# EasyEDA Pro project ProPrj_omb-2024-nano_2026-02-09.epro, board PCB1_1
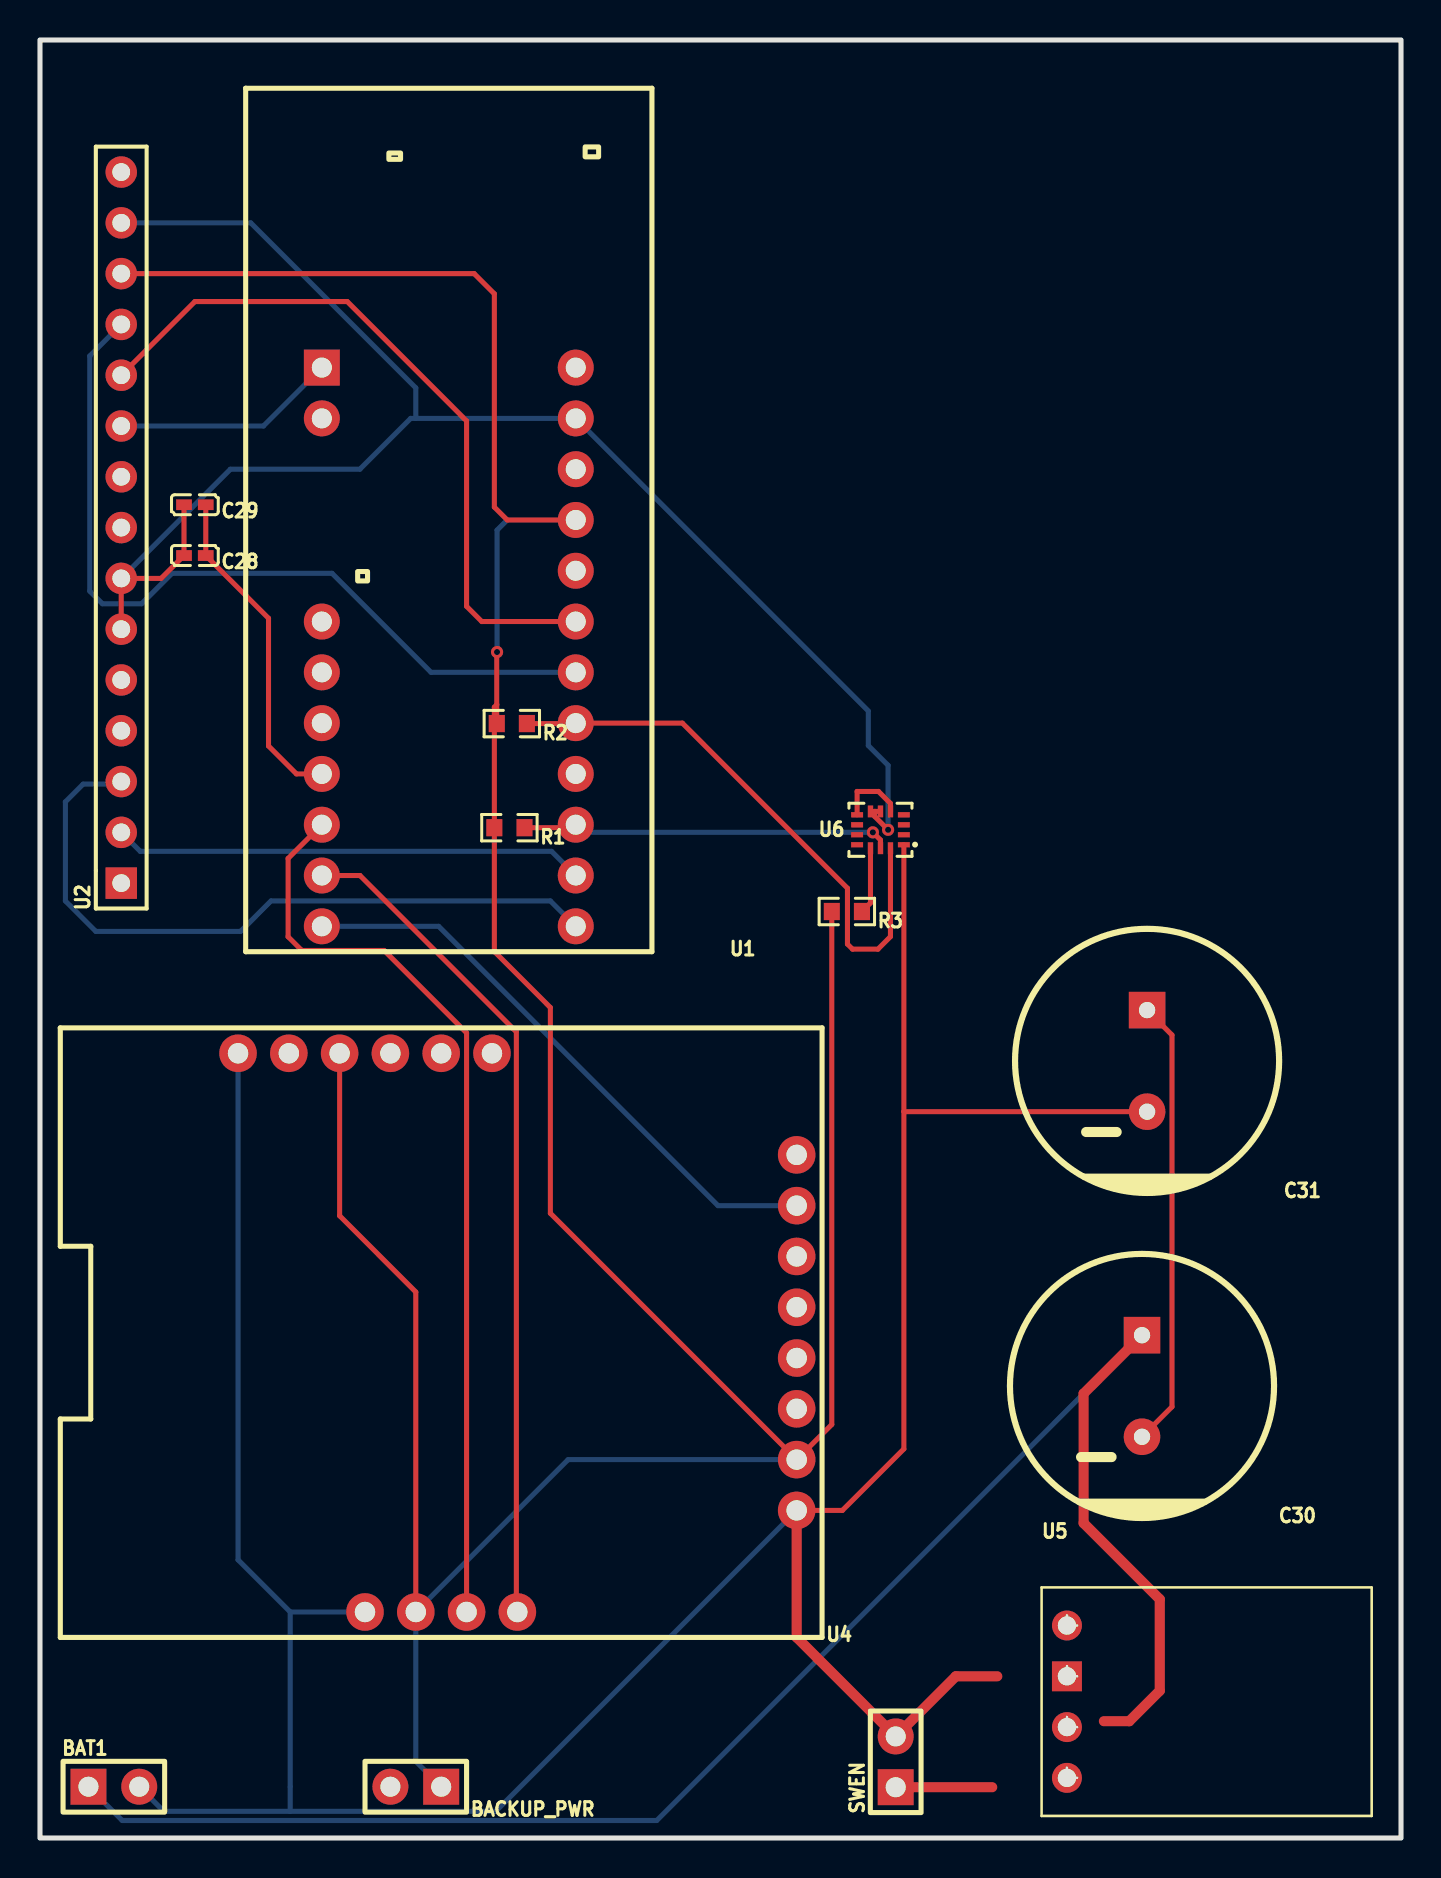
[diagram p13: board, top side]
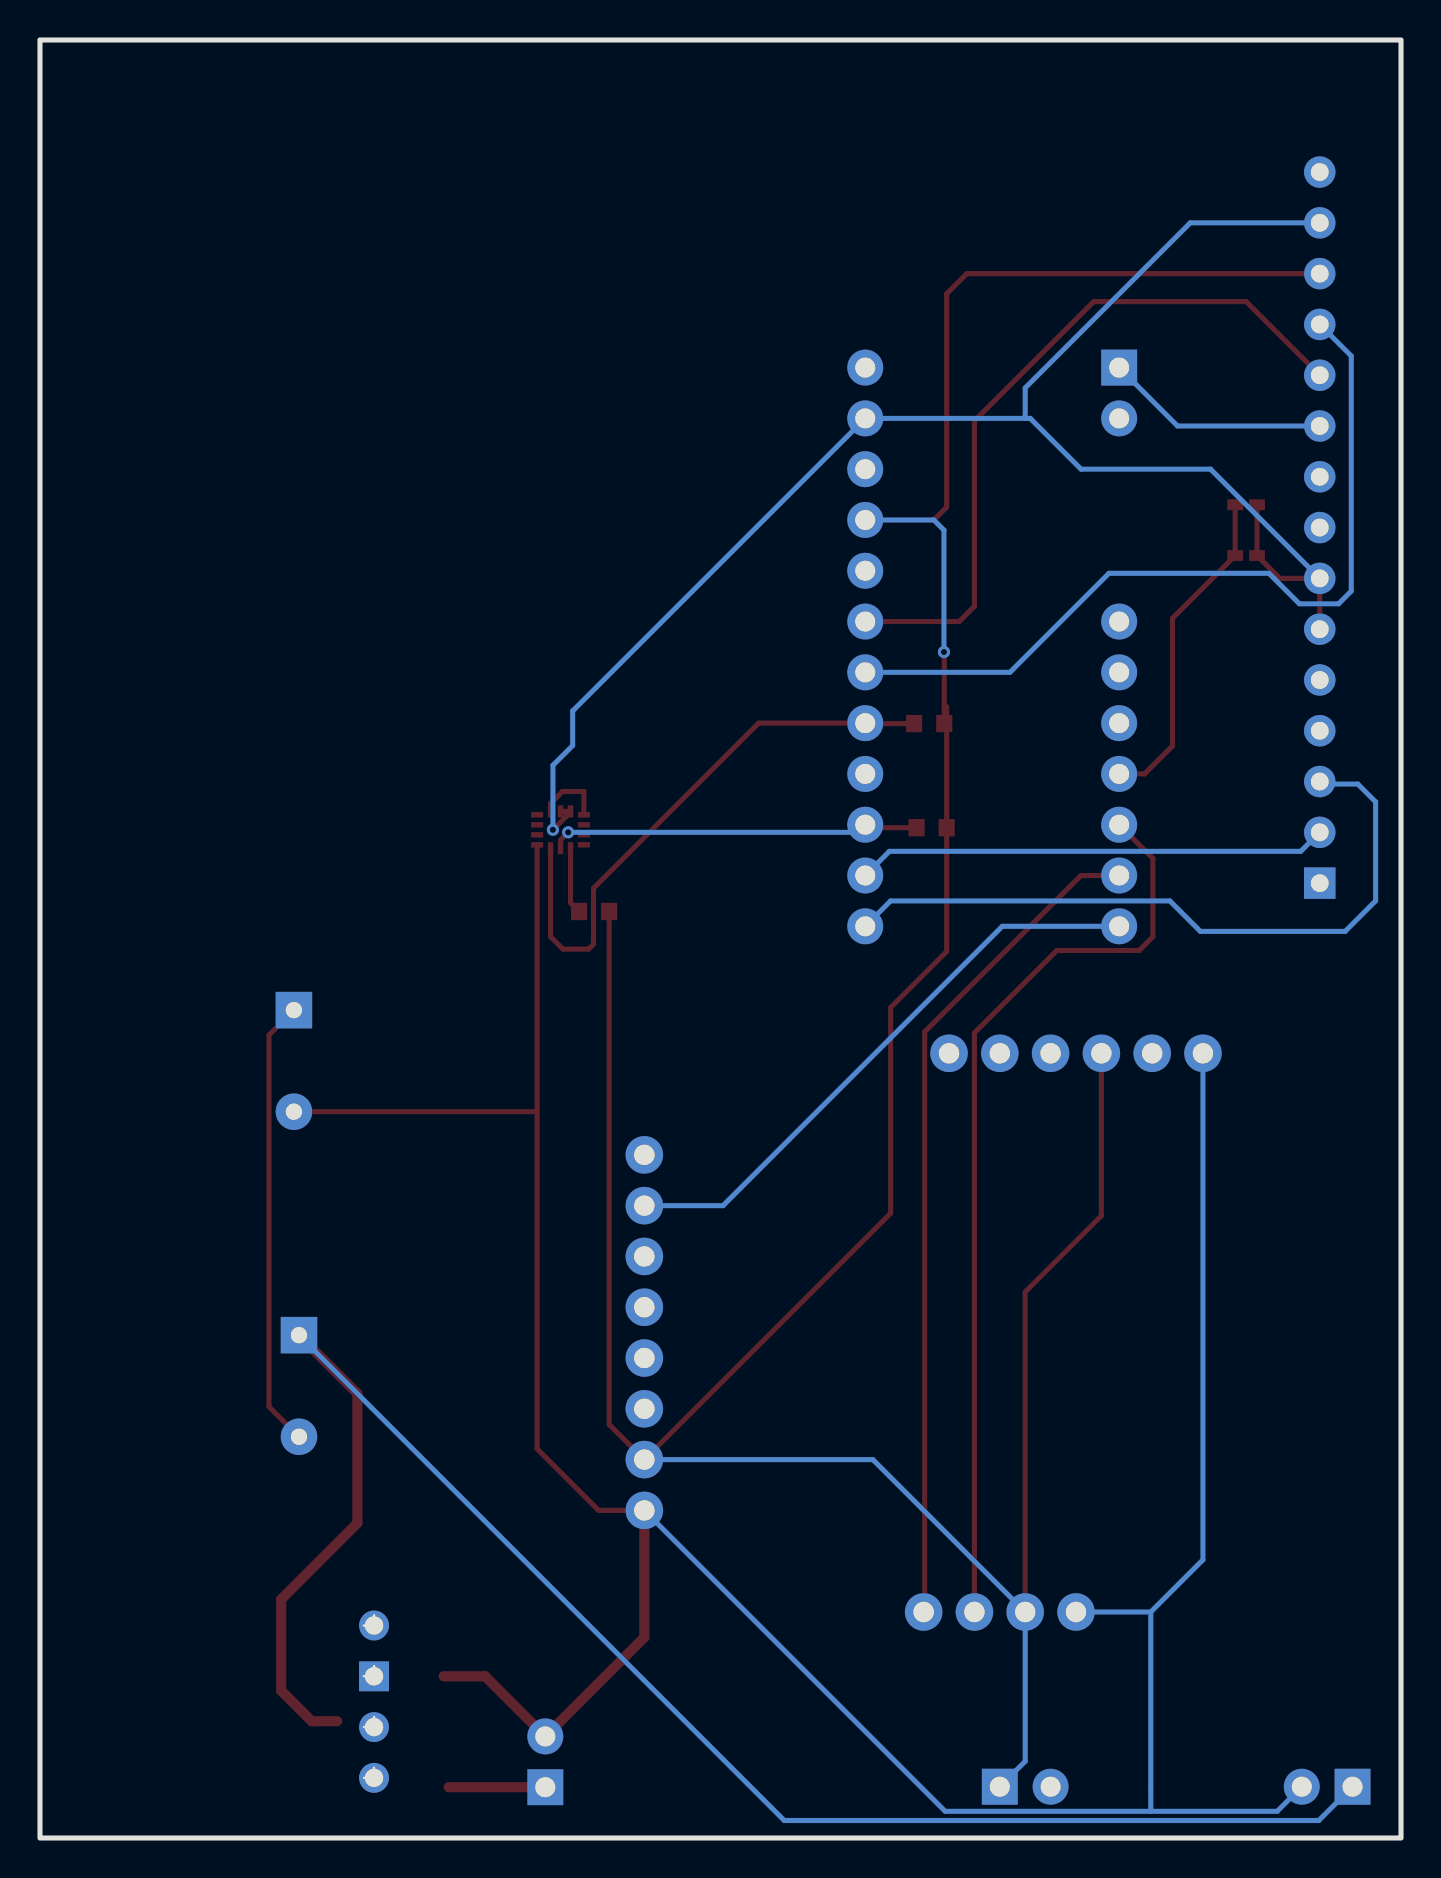
[diagram p14: board, bottom side, seen from below]

Outline 68.07 x 89.92 mm; copper layers: Top Layer, Bottom Layer. Coordinates in mm from the lower left corner of the outline.
Outline path: rectangle 0,89.92 68.07,0
Stack: Top Layer 0.035mm / Dielectric1 1.51mm FR4 er 4.5 / Bottom Layer 0.035mm

## Design rules (mm)
template: JLCPCB Capability(Two Layers Board)
spacing copperThickness1oz (default): track to track 0.102, other pairs 0.152 to 0.3
spacing copperThickness2oz: track to track 0.203, other pairs 0.152 to 0.3
track width copperThickness1oz (default): min 0.127, default 0.254, max 2.54
track width copperThickness2oz: min 0.203, default 0.254, max 2.54
differential pair differentialPair (default): width min 0.127, default 0.254, max 2.54; gap min 0.152, default 0.152
via viaSize (default): diameter min 0.5, default 0.61, max 10; hole min 0.3, default 0.305, max 6.3

## Placement (name value [footprint] x y rotation side)
BACKUP_PWR  22284020  [HDR-TH_2P-P2.54-V-M-1]  18.8 2.56 180 top
BAT1  22284020  [HDR-TH_2P-P2.54-V-M-1]  3.69 2.56 0 top
C28  100nF  [C0402]  7.75 64.14 180 top
C29  100nF  [C0402]  7.75 66.68 180 top
C30  10F  [CP_12.5X20MM]  55.12 22.61 180 top
C31  10F  [CP_12.5X20MM]  55.37 38.86 180 top
R1  10K  [R0603]  23.48 50.52 180 top
R2  10K  [R0603]  23.6 55.73 180 top
R3  10K  [R0603]  40.36 46.33 180 top
SWEN  22284020  [HDR-TH_2P-P2.54-V-M-1]  42.8 3.81 90 top
U1  -  [ARTEMIS REDBOARD NANO]  26.8 45.59 180 top
U2  -  [HDR-F-2.54_1X15]  4.06 65.53 90 top
U4  -  [SPARKFUN_U-BLOX_MAX-M10S]  39.24 40.64 180 top
U5  -  [S7V8F3]  51.36 6.82 0 top
U6  ISM330DHCXTR  [LGA-14_L3.0-W2.5-P0.50-BR]  42.04 50.42 0 top

## Footprints (pads in the part's own frame, mm; a bottom-side part is the same pattern mirrored in y, then rotated)
ARTEMIS REDBOARD NANO
  rect 1.8x1.8 hole 1: 1(12.7,-27.94)
  round 1.8 hole 1: 2(12.7,-25.4) 3(12.7,-15.24) 4(12.7,-12.7) 5(12.7,-10.16) 6(12.7,-7.62) 7(12.7,-5.08) 8(12.7,-2.54) 9(12.7,0) 10(0,0) 11(0,-2.54) 12(0,-5.08) 13(0,-7.62) 14(0,-10.16) 15(0,-12.7) 16(0,-15.24) 17(0,-17.78) 18(0,-20.32) 19(0,-22.86) 20(0,-25.4) 21(0,-27.94)
C0402
  rect 0.79x0.54 smd: 1(-0.545,0) 2(0.545,0)
CP_12.5X20MM
  rect 1.829x1.829 hole 0.813: 1(0,-2.54)
  round 1.829 hole 0.813: 2(0,2.54)
HDR-F-2.54_1X15
  rect 1.575x1.575 hole 0.889: 1(-17.78,0)
  round 1.575 hole 0.889: 2(-15.24,0) 3(-12.7,0) 4(-10.16,0) 5(-7.62,0) 6(-5.08,0) 7(-2.54,0) 8(0,0) 9(2.54,0) 10(5.08,0) 11(7.62,0) 12(10.16,0) 13(12.7,0) 14(15.24,0) 15(17.78,0)
HDR-TH_2P-P2.54-V-M-1
  rect 1.8x1.8 hole 1: 1(-1.27,0)
  round 1.8 hole 1: 2(1.27,0)
LGA-14_L3.0-W2.5-P0.50-BR
  rect 0.6x0.27 smd: 1(1.17,-0.75) 2(1.17,-0.25) 3(1.17,0.25) 4(1.17,0.75) 8(-1.17,0.75) 9(-1.17,0.25) 10(-1.17,-0.25) 11(-1.17,-0.75)
  rect 0.27x0.6 smd: 5(0.5,0.92) 6(0,0.92) 7(-0.5,0.92) 12(-0.5,-0.92) 13(0,-0.92) 14(0.5,-0.92)
R0603
  rect 0.806x0.864 smd: 1(-0.753,0) 2(0.753,0)
S7V8F3
  round 1.498 hole 0.914: 1(0,3.81) 3(0,-1.27) 4(0,-3.81)
  rect 1.498x1.498 hole 0.914: 2(0,1.27)
SPARKFUN_U-BLOX_MAX-M10S
  round 1.879 hole 1.021x1.016: 1(1.397,24.257) 2(1.397,21.717) 3(1.397,19.177) 4(1.397,16.637) 5(1.397,14.097) 6(1.397,11.557) 7(1.397,9.017) 8(1.397,6.477)
  round 1.879 hole 1.016x1.021: 9(16.637,1.397) 10(19.177,1.397) 11(21.717,1.397) 12(24.257,1.397) 13(26.797,1.397) 14(29.337,1.397) 15(15.367,29.337) 16(17.907,29.337) 17(20.447,29.337) 18(22.987,29.337)

## Nets
As in the schematic.

Pads without a net: U1 2 3 4 5 13 17 19 21; U2 1 4 5 8 9 15; U4 3 4 5 6 8 9 10 11 13; U6 2 3 4 9 10 11

## Via types
v1: diameter 0.61, hole 0.305, Top Layer to Bottom Layer, 3 vias

## Routing (per net, layer and track width the routed paths; a pad name or vN(x,y) marks a point on that pad's centre or on a via; arc(x,y) is an arc through that point)
GND: length 234.2
  Top Layer w0.254: 41.75,51.34 41.75,51.09 v1(42.42,50.42) ; 41.75,51.34 U6.6 ; 41.75,51.34 U6.7 ; U2.6 U2.7 6.06,62.99 C28.2 C29.2 ; U4.1 40.13,16.38 43.21,19.46 43.21,36.32 ; U6.1 43.21,36.32 ; 43.21,36.32 C31.2
  Top Layer w0.508: U4.1 37.85,10.03 SWEN.2 45.81,8.09 47.88,8.09
  Bottom Layer w0.254: U2.7 9.52,68.45 16,68.45 18.54,70.99 18.8,70.99 ; U4.1 22.8,1.33 12.52,1.33 ; 12.52,11.3 9.91,13.91 9.91,39.24 ; 12.52,11.3 12.52,1.33 ; 12.52,11.3 U4.18 ; 12.52,1.33 6.19,1.33 BAT1.2 ; 18.8,70.99 U1.20 41.43,56.36 41.43,54.63 42.42,53.64 v1(42.42,50.42) ; 18.8,70.99 18.8,72.52 10.54,80.77 U2.14
VBAT+: length 87.4
  Top Layer w0.508: 55.12,25.15 52.2,22.23 52.2,15.75 56.01,11.94 56.01,7.37 54.48,5.84 53.21,5.84
  Bottom Layer w0.254: 55.12,25.15 30.85,0.88 4.11,0.88 BAT1.1
VCC: length 181.2
  Top Layer w0.254: 22.84,56.67 R2.2 22.72,55.73 ; 22.84,56.67 22.72,56.55 22.72,55.73 ; 22.84,56.67 22.84,59.29 v1(22.86,59.31) ; 14.99,39.24 14.99,31.12 18.8,27.31 18.8,11.3 ; 22.72,55.73 R1.2 22.72,44.33 25.53,41.53 25.53,31.24 U4.2 39.6,20.68 R3.2 ; U2.13 21.72,78.23 22.72,77.22 22.72,66.56 23.37,65.91 U1.18
  Bottom Layer w0.254: BACKUP_PWR.1 18.8,3.83 18.8,11.3 26.42,18.92 U4.2 ; v1(22.86,59.31) 22.86,65.41 23.37,65.91 U1.18
GPSWAKE: length 29.5
  Bottom Layer w0.254: U1.9 19.94,45.59 33.91,31.62 U4.7
I_CS: length 3.3
  Top Layer w0.254: R3.1 41.54,46.76 U6.12
I_SCL: length 18.6
  Top Layer w0.254: U1.12 26.65,50.52 R1.1 ; v1(41.66,50.29) 42.04,49.91 U6.13
  Bottom Layer w0.254: v1(41.66,50.29) 27.18,50.29 U1.12
I_SDA: length 29.2
  Top Layer w0.254: U6.14 42.54,45.08 41.91,44.45 40.64,44.45 40.39,44.7 40.39,47.5 32.13,55.75 U1.14 26.77,55.73 R2.1
I_VCC: length 20.1
  Top Layer w0.254: U6.5 42.54,51.74 41.94,52.34 40.87,52.34 U6.8 ; C29.1 C28.1 11.43,61 11.43,54.61 12.83,53.21 U1.6
$1N1205: length 41.2
  Bottom Layer w0.254: U2.12 2.49,74.12 2.49,62.36 3.12,61.72 5.08,61.72 6.6,63.25 14.6,63.25 19.56,58.29 U1.15
$1N1212: length 23.6
  Bottom Layer w0.254: U2.2 5.01,49.34 25.59,49.34 U1.11
$1N1219: length 35.5
  Bottom Layer w0.254: U2.3 3.94,52.71 2.16,52.71 1.27,51.82 1.27,46.86 2.79,45.34 10.03,45.34 11.56,46.86 25.53,46.86 U1.10
$1N1474: length 46.2
  Top Layer w0.254: U1.7 12.41,48.98 12.41,45.07 13.09,44.38 17.21,44.38 21.34,40.26 U4.16
$1N1527: length 42
  Top Layer w0.254: U1.8 16,48.13 23.83,40.31 23.83,11.35 U4.15
$1N1582: length 36.3
  Top Layer w0.254: U2.11 7.75,76.84 15.37,76.84 21.34,70.87 21.34,61.59 22.1,60.83 U1.16
$1N1610: length 11.2
  Bottom Layer w0.254: U2.10 11.18,70.61 U1.1
$1N2154: length 4.8
  Top Layer w0.508: SWEN.1 47.62,2.54
$1N2984: length 22.5
  Top Layer w0.254: C30.2 56.62,21.57 56.62,40.16 55.37,41.4
